# Altium project Phaser.PrjPCB (part 1 of 11)
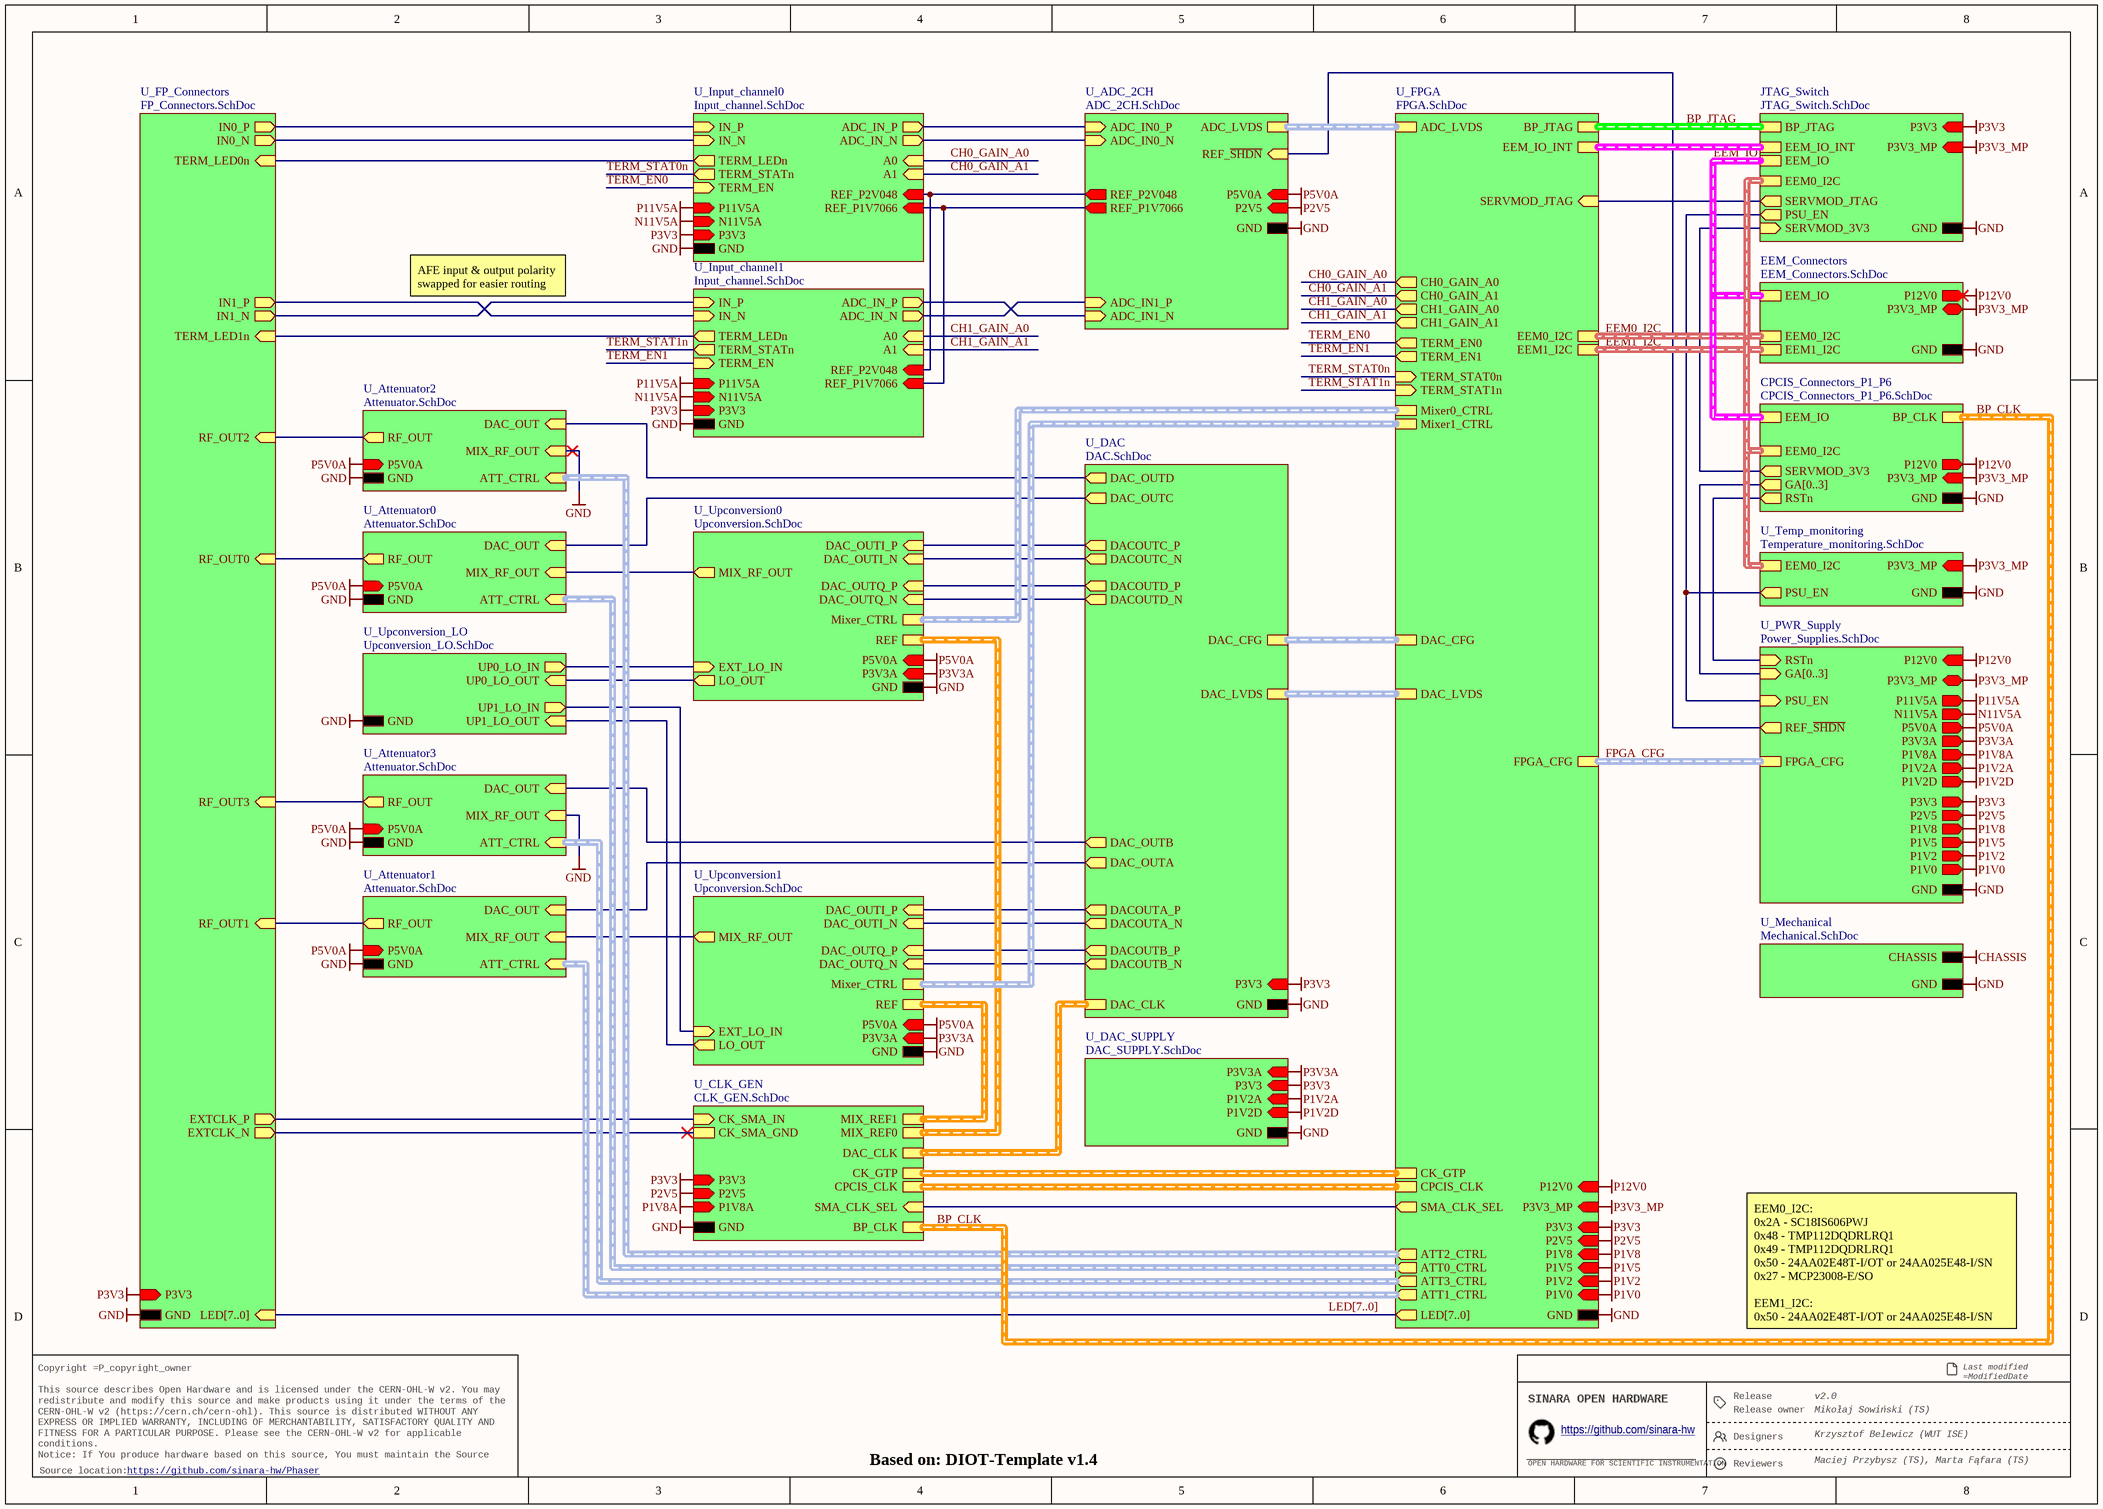
[diagram p0: Phaser.SchDoc]
P_copyright_owner: WUT ISE 2024-2026 · Technosystem 2025-2026; P_github_link: https://github.com/sinara-hw/Phaser; P_release_designers: Krzysztof Belewicz (WUT ISE); P_release_owner: Mikołaj Sowiński (TS); P_release_reviewers: Maciej Przybysz (TS), Marta Fąfara (TS); P_template_version: 1.4; P_version: 2.0
30 sheets, 1236 parts. Net scope: strictly hierarchical (ports join the sheet entries above them; power ports are local).
Board file: Phaser.PcbDoc
Sheets:
  Phaser.SchDoc
    U_PWR_Supply = Power_Supplies.SchDoc
      U_Power-up_delay = Power-up_delay.SchDoc
      U_Power_main_DCDC = Power_main_DCDC.SchDoc
      LEDs = LEDs.SchDoc
      U_Power_AFE_DCDC = Power_AFE_DCDC.SchDoc
    CPCIS_Connectors_P1_P6 = CPCIS_Connectors_P1_P6.SchDoc
      U_DIOT_signal_routing = DIOT_signal_routing.SchDoc
    EEM_Connectors = EEM_Connectors.SchDoc
    U_Temp_monitoring = Temperature_monitoring.SchDoc
    U_Mechanical = Mechanical.SchDoc
    U_FPGA = FPGA.SchDoc
      U_FPGA_Bank13-14 = FPGA_Bank13-14.SchDoc
      U_FPGA_Supply = FPGA_Supply.SchDoc
      U_FPGA_Config = FPGA_Config.SchDoc
      U_FPGA_Bank34 = FPGA_Bank34.SchDoc
      U_FPGA_Bank15-16 = FPGA_Bank15-16.SchDoc
      U_FPGA_SDRAM = FPGA_SDRAM.SchDoc
      U_FPGA_GTP = FPGA_GTP.SchDoc
      U_I2C switch_0 = I2C_switch.SchDoc
      U_I2C switch_1 = I2C_switch.SchDoc
    U_FP_Connectors = FP_Connectors.SchDoc
    U_CLK_GEN = CLK_GEN.SchDoc
    U_Input_channel0 = Input_channel.SchDoc
    U_DAC = DAC.SchDoc
    U_Upconversion0 = Upconversion.SchDoc
    U_DAC_SUPPLY = DAC_SUPPLY.SchDoc
    U_Input_channel1 = Input_channel.SchDoc
    U_ADC_2CH = ADC_2CH.SchDoc
    U_Upconversion_LO = Upconversion_LO.SchDoc
    U_Upconversion1 = Upconversion.SchDoc
    U_Attenuator0 = Attenuator.SchDoc
    U_Attenuator2 = Attenuator.SchDoc
    U_Attenuator1 = Attenuator.SchDoc
    U_Attenuator3 = Attenuator.SchDoc
    JTAG_Switch = JTAG_Switch.SchDoc

## Sheet Phaser.SchDoc: =DocumentName
size A3; Version: 2.0; Github: https://github.com/sinara-hw/Phaser; DocumentNumber: 1; Revision: 0; SheetNumber: 1; SheetTotal: 30

### Sub-sheets
CPCIS_Connectors_P1_P6 = CPCIS_Connectors_P1_P6.SchDoc: EEM_IO (harness EEM_LVDS), BP_CLK (harness CLK_DIFF), EEM0_I2C (harness I2C), SERVMOD_3V3 (out), GA[0..3] (out), RSTn (out), GND, P3V3_MP (in), P12V0 (out)
EEM_Connectors = EEM_Connectors.SchDoc: P3V3_MP (bidir), P12V0 (out), EEM_IO (harness EEM_LVDS), EEM1_I2C (harness I2C), EEM0_I2C (harness I2C), GND
JTAG_Switch = JTAG_Switch.SchDoc: BP_JTAG (harness BP_JTAG), EEM_IO_INT (harness EEM_LVDS), P3V3_MP (in), P3V3 (in), EEM0_I2C (harness I2C), EEM_IO (harness EEM_LVDS), SERVMOD_3V3 (in), PSU_EN (out), SERVMOD_JTAG (out), GND
U_ADC_2CH = ADC_2CH.SchDoc: REF_~{SHDN} (in), ADC_IN0_P (in), ADC_IN1_P (in), ADC_IN0_N (in), ADC_IN1_N (in), ADC_LVDS (harness ADC_LVDS), P5V0A (in), P2V5 (in), REF_P2V048 (out), REF_P1V7066 (out), GND
U_Attenuator0 = Attenuator.SchDoc: RF_OUT (out), ATT_CTRL (in, harness ATT_CTRL), DAC_OUT (in), MIX_RF_OUT (in), GND, P5V0A (in)
U_Attenuator1 = Attenuator.SchDoc: RF_OUT (out), ATT_CTRL (in, harness ATT_CTRL), DAC_OUT (in), MIX_RF_OUT (in), GND, P5V0A (in)
U_Attenuator2 = Attenuator.SchDoc: RF_OUT (out), DAC_OUT (in), MIX_RF_OUT (in), GND, P5V0A (in), ATT_CTRL (in, harness ATT_CTRL)
U_Attenuator3 = Attenuator.SchDoc: RF_OUT (out), DAC_OUT (in), MIX_RF_OUT (in), GND, P5V0A (in), ATT_CTRL (in, harness ATT_CTRL)
U_CLK_GEN = CLK_GEN.SchDoc: CK_SMA_IN (in), SMA_CLK_SEL (in), CK_GTP (harness CLK_DIFF), MIX_REF0 (harness CLK_DIFF), MIX_REF1 (harness CLK_DIFF), DAC_CLK (harness CLK_DIFF), CK_SMA_GND, GND, BP_CLK (harness CLK_DIFF), P2V5 (in), P1V8A (in), CPCIS_CLK (harness CLK_DIFF), P3V3 (in)
U_DAC = DAC.SchDoc: DAC_CFG (harness DAC_CFG), DAC_LVDS (harness DAC_LVDS), DAC_CLK (harness CLK_DIFF), DAC_OUTC (out), DAC_OUTA (out), DACOUTD_P (out), DACOUTD_N (out), DACOUTC_N (out), DACOUTC_P (out), DACOUTA_P (out), DACOUTA_N (out), DACOUTB_N (out), DACOUTB_P (out), GND, P3V3 (in), DAC_OUTD (out), DAC_OUTB (out)
U_DAC_SUPPLY = DAC_SUPPLY.SchDoc: P3V3A (in), P3V3 (in), P1V2A (in), P1V2D (in), GND
U_FP_Connectors = FP_Connectors.SchDoc: GND, P3V3 (in), IN0_P (out), IN0_N (out), IN1_P (out), IN1_N (out), RF_OUT2 (in), RF_OUT1 (in), EXTCLK_P (out), EXTCLK_N (out), RF_OUT0 (in), RF_OUT3 (in), LED[7..0] (in), TERM_LED0n (in), TERM_LED1n (in)
U_FPGA = FPGA.SchDoc: ADC_LVDS (harness ADC_LVDS), DAC_CFG (harness DAC_CFG), DAC_LVDS (harness DAC_LVDS), LED[7..0] (out), TERM_STAT1n (in), TERM_STAT0n (in), Mixer1_CTRL (harness Mixer_CTRL), Mixer0_CTRL (harness Mixer_CTRL), ATT2_CTRL (out, harness ATT_CTRL), SMA_CLK_SEL (out), GND, CK_GTP (harness CLK_DIFF), CPCIS_CLK (harness CLK_DIFF), P1V2 (in), P2V5 (in), P3V3 (in), P3V3_MP (in), P1V5 (in), P1V8 (in), P1V0 (in), P12V0 (in), ATT0_CTRL (out, harness ATT_CTRL), ATT3_CTRL (out, harness ATT_CTRL), ATT1_CTRL (out, harness ATT_CTRL), CH0_GAIN_A0 (out), CH0_GAIN_A1 (out), CH1_GAIN_A0 (out), CH1_GAIN_A1 (out), TERM_EN0 (out), TERM_EN1 (out), EEM_IO_INT (harness EEM_LVDS), BP_JTAG (harness BP_JTAG), SERVMOD_JTAG (in), FPGA_CFG (harness FPGA_CFG), EEM1_I2C (harness I2C), EEM0_I2C (harness I2C)
U_Input_channel0 = Input_channel.SchDoc: IN_N (in), A0 (in), A1 (in), IN_P (in), ADC_IN_P (out), ADC_IN_N (out), REF_P1V7066 (in), REF_P2V048 (in), GND, TERM_STATn (out), TERM_EN (in), P11V5A (in), N11V5A (in), P3V3 (in), TERM_LEDn (out)
U_Input_channel1 = Input_channel.SchDoc: IN_N (in), A0 (in), A1 (in), IN_P (in), ADC_IN_P (out), ADC_IN_N (out), TERM_STATn (out), REF_P1V7066 (in), REF_P2V048 (in), GND, TERM_EN (in), P11V5A (in), N11V5A (in), P3V3 (in), TERM_LEDn (out)
U_Mechanical = Mechanical.SchDoc: CHASSIS, GND
U_PWR_Supply = Power_Supplies.SchDoc: P12V0 (in), P3V3_MP (bidir), GND, P5V0A (out), P3V3A (out), P1V8A (out), P1V2A (out), P1V2D (out), P3V3 (out), P2V5 (out), P1V8 (out), P1V5 (out), P1V2 (out), P1V0 (out), P11V5A (out), N11V5A (out), RSTn (in), GA[0..3] (in), PSU_EN (in), REF_~{SHDN} (out), FPGA_CFG (harness FPGA_CFG)
U_Temp_monitoring = Temperature_monitoring.SchDoc: GND, P3V3_MP (in), EEM0_I2C (harness I2C), PSU_EN (out)
U_Upconversion0 = Upconversion.SchDoc: DAC_OUTI_P (in), DAC_OUTI_N (in), DAC_OUTQ_N (in), DAC_OUTQ_P (in), REF (harness CLK_DIFF), MIX_RF_OUT (out), Mixer_CTRL (harness Mixer_CTRL), EXT_LO_IN (in), LO_OUT (out), P5V0A (in), P3V3A (in), GND
U_Upconversion1 = Upconversion.SchDoc: DAC_OUTI_P (in), DAC_OUTI_N (in), DAC_OUTQ_N (in), DAC_OUTQ_P (in), REF (harness CLK_DIFF), MIX_RF_OUT (out), Mixer_CTRL (harness Mixer_CTRL), EXT_LO_IN (in), LO_OUT (out), P5V0A (in), P3V3A (in), GND
U_Upconversion_LO = Upconversion_LO.SchDoc: GND, UP0_LO_IN (out), UP0_LO_OUT (in), UP1_LO_IN (out), UP1_LO_OUT (in)

### Nets
GND: sheet U_PWR_Supply/GND, sheet CPCIS_Connectors_P1_P6/GND, sheet EEM_Connectors/GND, sheet U_Temp_monitoring/GND, sheet U_Mechanical/GND, sheet U_FPGA/GND, sheet U_FP_Connectors/GND, sheet U_CLK_GEN/GND, sheet U_Input_channel0/GND, sheet U_DAC/GND, sheet U_Upconversion0/GND, sheet U_DAC_SUPPLY/GND, sheet U_Input_channel1/GND, sheet U_ADC_2CH/GND, sheet U_Upconversion_LO/GND, sheet U_Upconversion1/GND, sheet U_Attenuator0/GND, sheet U_Attenuator2/MIX_RF_OUT, sheet U_Attenuator2/GND, sheet U_Attenuator1/GND, sheet U_Attenuator3/MIX_RF_OUT, sheet U_Attenuator3/GND, sheet JTAG_Switch/GND
N11V5A: sheet U_PWR_Supply/N11V5A, sheet U_Input_channel0/N11V5A, sheet U_Input_channel1/N11V5A
P1V0: sheet U_PWR_Supply/P1V0, sheet U_FPGA/P1V0
P1V2: sheet U_PWR_Supply/P1V2, sheet U_FPGA/P1V2
P1V2A: sheet U_PWR_Supply/P1V2A, sheet U_DAC_SUPPLY/P1V2A
P1V2D: sheet U_PWR_Supply/P1V2D, sheet U_DAC_SUPPLY/P1V2D
P1V5: sheet U_PWR_Supply/P1V5, sheet U_FPGA/P1V5
P1V8: sheet U_PWR_Supply/P1V8, sheet U_FPGA/P1V8
P1V8A: sheet U_PWR_Supply/P1V8A, sheet U_CLK_GEN/P1V8A
P2V5: sheet U_PWR_Supply/P2V5, sheet U_FPGA/P2V5, sheet U_CLK_GEN/P2V5, sheet U_ADC_2CH/P2V5
P3V3: sheet U_PWR_Supply/P3V3, sheet U_FPGA/P3V3, sheet U_FP_Connectors/P3V3, sheet U_CLK_GEN/P3V3, sheet U_Input_channel0/P3V3, sheet U_DAC/P3V3, sheet U_DAC_SUPPLY/P3V3, sheet U_Input_channel1/P3V3, sheet JTAG_Switch/P3V3
P3V3_MP: sheet U_PWR_Supply/P3V3_MP, sheet CPCIS_Connectors_P1_P6/P3V3_MP, sheet EEM_Connectors/P3V3_MP, sheet U_Temp_monitoring/P3V3_MP, sheet U_FPGA/P3V3_MP, sheet JTAG_Switch/P3V3_MP
P3V3A: sheet U_PWR_Supply/P3V3A, sheet U_Upconversion0/P3V3A, sheet U_DAC_SUPPLY/P3V3A, sheet U_Upconversion1/P3V3A
P5V0A: sheet U_PWR_Supply/P5V0A, sheet U_Upconversion0/P5V0A, sheet U_ADC_2CH/P5V0A, sheet U_Upconversion1/P5V0A, sheet U_Attenuator0/P5V0A, sheet U_Attenuator2/P5V0A, sheet U_Attenuator1/P5V0A, sheet U_Attenuator3/P5V0A
P11V5A: sheet U_PWR_Supply/P11V5A, sheet U_Input_channel0/P11V5A, sheet U_Input_channel1/P11V5A
P12V0: sheet U_PWR_Supply/P12V0, sheet CPCIS_Connectors_P1_P6/P12V0, sheet EEM_Connectors/P12V0, sheet U_FPGA/P12V0
REF_P1V7066: sheet U_Input_channel0/REF_P1V7066, sheet U_Input_channel1/REF_P1V7066, sheet U_ADC_2CH/REF_P1V7066
REF_P2V048: sheet U_Input_channel0/REF_P2V048, sheet U_Input_channel1/REF_P2V048, sheet U_ADC_2CH/REF_P2V048
ADC_IN0_N: sheet U_Input_channel0/ADC_IN_N, sheet U_ADC_2CH/ADC_IN0_N
ADC_IN0_P: sheet U_Input_channel0/ADC_IN_P, sheet U_ADC_2CH/ADC_IN0_P
ADC_IN1_N: sheet U_Input_channel1/ADC_IN_P, sheet U_ADC_2CH/ADC_IN1_N
ADC_IN1_P: sheet U_Input_channel1/ADC_IN_N, sheet U_ADC_2CH/ADC_IN1_P
BBI_N: sheet U_DAC/DACOUTA_N, sheet U_Upconversion1/DAC_OUTI_N
BBI_N: sheet U_DAC/DACOUTC_N, sheet U_Upconversion0/DAC_OUTI_N  [a separate net that carries the same name]
BBI_P: sheet U_DAC/DACOUTA_P, sheet U_Upconversion1/DAC_OUTI_P
BBI_P: sheet U_DAC/DACOUTC_P, sheet U_Upconversion0/DAC_OUTI_P  [a separate net that carries the same name]
BBQ_N: sheet U_DAC/DACOUTB_N, sheet U_Upconversion1/DAC_OUTQ_N
BBQ_N: sheet U_DAC/DACOUTD_N, sheet U_Upconversion0/DAC_OUTQ_N  [a separate net that carries the same name]
BBQ_P: sheet U_DAC/DACOUTB_P, sheet U_Upconversion1/DAC_OUTQ_P
BBQ_P: sheet U_DAC/DACOUTD_P, sheet U_Upconversion0/DAC_OUTQ_P  [a separate net that carries the same name]
CH0_GAIN_A0: sheet U_FPGA/CH0_GAIN_A0, sheet U_Input_channel0/A0
CH0_GAIN_A1: sheet U_FPGA/CH0_GAIN_A1, sheet U_Input_channel0/A1
CH1_GAIN_A0: sheet U_FPGA/CH1_GAIN_A0, sheet U_Input_channel1/A0
CH1_GAIN_A1: sheet U_FPGA/CH1_GAIN_A1, sheet U_Input_channel1/A1
PSU_EN: sheet U_PWR_Supply/PSU_EN, sheet U_Temp_monitoring/PSU_EN, sheet JTAG_Switch/PSU_EN
REF_~{SHDN}: sheet U_PWR_Supply/REF_~{SHDN}, sheet U_ADC_2CH/REF_~{SHDN}
RSTn: sheet U_PWR_Supply/RSTn, sheet CPCIS_Connectors_P1_P6/RSTn
SERVMOD_3V3: sheet CPCIS_Connectors_P1_P6/SERVMOD_3V3, sheet JTAG_Switch/SERVMOD_3V3
SERVMOD_JTAG: sheet U_FPGA/SERVMOD_JTAG, sheet JTAG_Switch/SERVMOD_JTAG
SMA_CLK_SEL: sheet U_FPGA/SMA_CLK_SEL, sheet U_CLK_GEN/SMA_CLK_SEL
TERM_EN0: sheet U_FPGA/TERM_EN0, sheet U_Input_channel0/TERM_EN
TERM_EN1: sheet U_FPGA/TERM_EN1, sheet U_Input_channel1/TERM_EN
TERM_STAT0n: sheet U_FPGA/TERM_STAT0n, sheet U_FP_Connectors/TERM_LED0n, sheet U_Input_channel0/TERM_STATn, sheet U_Input_channel0/TERM_LEDn
TERM_STAT1n: sheet U_FPGA/TERM_STAT1n, sheet U_FP_Connectors/TERM_LED1n, sheet U_Input_channel1/TERM_STATn, sheet U_Input_channel1/TERM_LEDn
NetC11_1: sheet U_FP_Connectors/IN0_N, sheet U_Input_channel0/IN_N
NetC31_1: sheet U_FP_Connectors/IN1_N, sheet U_Input_channel1/IN_P
NetC37_1: sheet U_FP_Connectors/EXTCLK_N, sheet U_CLK_GEN/CK_SMA_GND
NetC133A_1: sheet U_Upconversion0/EXT_LO_IN, sheet U_Upconversion_LO/UP0_LO_IN
NetC133B_1: sheet U_Upconversion_LO/UP1_LO_IN, sheet U_Upconversion1/EXT_LO_IN
NetC196_2: sheet U_FP_Connectors/EXTCLK_P, sheet U_CLK_GEN/CK_SMA_IN
NetC270A_2: sheet U_DAC/DAC_OUTC, sheet U_Attenuator0/DAC_OUT
NetC270B_2: sheet U_DAC/DAC_OUTA, sheet U_Attenuator1/DAC_OUT
NetC270C_2: sheet U_DAC/DAC_OUTD, sheet U_Attenuator2/DAC_OUT
NetC270D_2: sheet U_DAC/DAC_OUTB, sheet U_Attenuator3/DAC_OUT
NetC272A_1: sheet U_FP_Connectors/RF_OUT0, sheet U_Attenuator0/RF_OUT
NetC272B_1: sheet U_FP_Connectors/RF_OUT1, sheet U_Attenuator1/RF_OUT
NetC272C_1: sheet U_FP_Connectors/RF_OUT2, sheet U_Attenuator2/RF_OUT
NetC272D_1: sheet U_FP_Connectors/RF_OUT3, sheet U_Attenuator3/RF_OUT
NetC354A_1: sheet U_Upconversion0/LO_OUT, sheet U_Upconversion_LO/UP0_LO_OUT
NetC354B_1: sheet U_Upconversion_LO/UP1_LO_OUT, sheet U_Upconversion1/LO_OUT
NetC369A_1: sheet U_Upconversion0/MIX_RF_OUT, sheet U_Attenuator0/MIX_RF_OUT
NetC369B_1: sheet U_Upconversion1/MIX_RF_OUT, sheet U_Attenuator1/MIX_RF_OUT
NetIC27B_6: sheet U_FP_Connectors/IN1_P, sheet U_Input_channel1/IN_N
NetJ13_1: sheet U_FP_Connectors/IN0_P, sheet U_Input_channel0/IN_P

### Buses and harness runs
bus LED[7..0] = sheet U_FP_Connectors/LED[7..0] = sheet U_FPGA/LED[7..0]
bus sheet CPCIS_Connectors_P1_P6/GA[0..3] = sheet U_PWR_Supply/GA[0..3]
harness BP_CLK = sheet CPCIS_Connectors_P1_P6/BP_CLK = sheet U_CLK_GEN/BP_CLK
harness BP_JTAG = sheet JTAG_Switch/BP_JTAG = sheet U_FPGA/BP_JTAG
harness EEM0_I2C = sheet CPCIS_Connectors_P1_P6/EEM0_I2C = sheet EEM_Connectors/EEM0_I2C = sheet JTAG_Switch/EEM0_I2C = sheet U_FPGA/EEM0_I2C = sheet U_Temp_monitoring/EEM0_I2C
harness EEM1_I2C = sheet EEM_Connectors/EEM1_I2C = sheet U_FPGA/EEM1_I2C
harness EEM_IO = sheet CPCIS_Connectors_P1_P6/EEM_IO = sheet EEM_Connectors/EEM_IO = sheet JTAG_Switch/EEM_IO
harness FPGA_CFG = sheet U_FPGA/FPGA_CFG = sheet U_PWR_Supply/FPGA_CFG
harness sheet JTAG_Switch/EEM_IO_INT = sheet U_FPGA/EEM_IO_INT
harness sheet U_ADC_2CH/ADC_LVDS = sheet U_FPGA/ADC_LVDS
harness sheet U_Attenuator0/ATT_CTRL = sheet U_FPGA/ATT0_CTRL
harness sheet U_Attenuator1/ATT_CTRL = sheet U_FPGA/ATT1_CTRL
harness sheet U_Attenuator2/ATT_CTRL = sheet U_FPGA/ATT2_CTRL
harness sheet U_Attenuator3/ATT_CTRL = sheet U_FPGA/ATT3_CTRL
harness sheet U_CLK_GEN/CK_GTP = sheet U_FPGA/CK_GTP
harness sheet U_CLK_GEN/CPCIS_CLK = sheet U_FPGA/CPCIS_CLK
harness sheet U_CLK_GEN/DAC_CLK = sheet U_DAC/DAC_CLK
harness sheet U_CLK_GEN/MIX_REF0 = sheet U_Upconversion0/REF
harness sheet U_CLK_GEN/MIX_REF1 = sheet U_Upconversion1/REF
harness sheet U_DAC/DAC_CFG = sheet U_FPGA/DAC_CFG
harness sheet U_DAC/DAC_LVDS = sheet U_FPGA/DAC_LVDS
harness sheet U_FPGA/Mixer0_CTRL = sheet U_Upconversion0/Mixer_CTRL
harness sheet U_FPGA/Mixer1_CTRL = sheet U_Upconversion1/Mixer_CTRL

### Notes on the sheet
- AFE input & output polarity swapped for easier routing
- EEM0_I2C:
  0x2A - SC18IS606PWJ
  0x48 - TMP112DQDRLRQ1
  0x49 - TMP112DQDRLRQ1
  0x50 - 24AA02E48T-I/OT or 24AA025E48-I/SN
  0x27 - MCP23008-E/SO
  EEM1_I2C:
  0x50 - 24AA02E48T-I/OT or 24AA025E48-I/SN
- Release
- Last modified =ModifiedDate
  Sheet =sheetnumber of =sheettotal · Size A3
- Copyright =P_copyright_owner
  This source describes Open Hardware and is licensed under the CERN-OHL-W v2. You may redistribute and modify this source and make products using it under the terms of the CERN-OHL-W v2 (https://cern.ch/cern-ohl). This source is distributed WITHOUT ANY EXPRESS OR IMPLIED WARRANTY, INCLUDING OF MERCHANTABILITY, SATISFACTORY QUALITY AND FITNESS FOR A PARTICULAR PURPOSE. Please see the CERN-OHL-W v2 for applicable conditions.
  Notice: If You produce hardware based on this source, You must maintain the Source Location visible on the product, its packaging or its documentation.
- SINARA OPEN HARDWARE
- OPEN HARDWARE FOR SCIENTIFIC INSTRUMENTATION
- https://github.com/sinara-hw
- Release owner
- Designers
- Reviewers
- Source location:

## Sheet Power_Supplies.SchDoc: =DocumentName
size A4; DocumentNumber: 1; Revision: 0; SheetNumber: 2; SheetTotal: 30
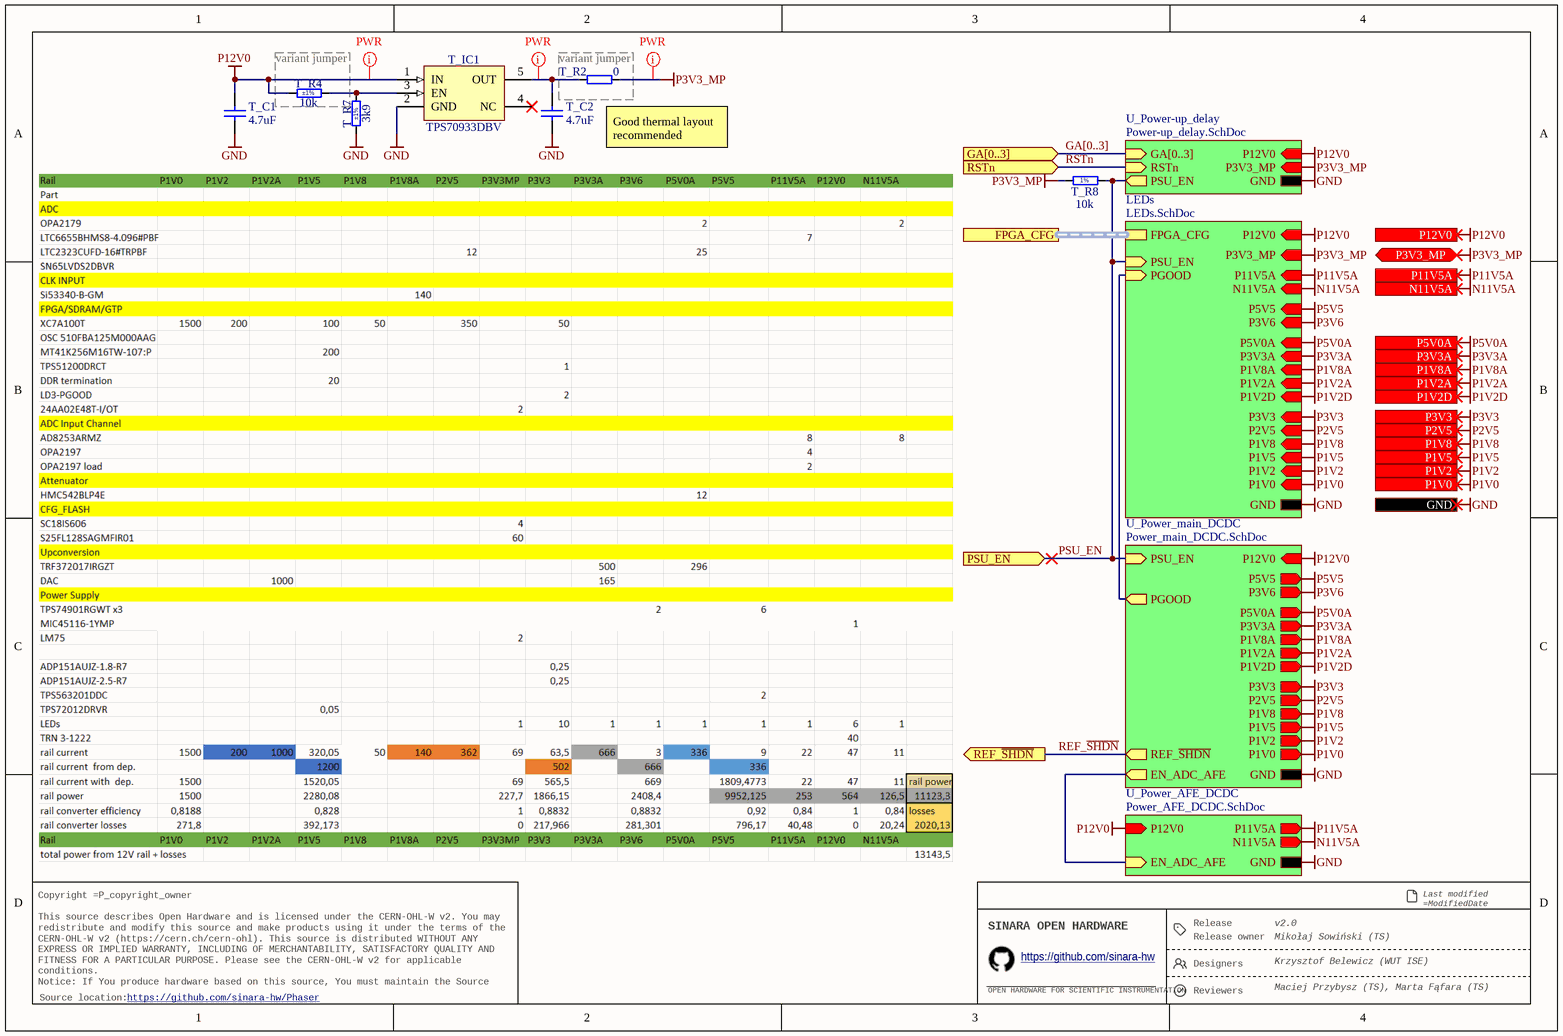
[diagram p1: Power_Supplies.SchDoc]

### Parts
T_C1  4.7uF  [CAPC2012X135N]
T_C2  4.7uF  [CAPC2012X135N]
T_IC1  TPS70933DBV  [SOT95P280X145-5N]
T_R2  0  [RESC1005X40N]
T_R4  10k  Tolerance: ±1%  [RESC1005X40N]
T_R7  3k9  Tolerance: ±1%  [RESC1005X40N]
T_R8  10k  [RESC1005X40N]

### Blocks framed on the sheet
variant jumper: T_R4
variant jumper: T_R2

### Sub-sheets
LEDs = LEDs.SchDoc: PSU_EN (in), PGOOD (in), P3V3_MP (in), P12V0 (in), FPGA_CFG (harness FPGA_CFG), P11V5A (in), N11V5A (in), GND, P5V0A (in), P3V3A (in), P1V8A (in), P1V2A (in), P1V2D (in), P3V3 (in), P2V5 (in), P1V8 (in), P1V5 (in), P1V2 (in), P1V0 (in), P5V5 (in), P3V6 (in)
U_Power-up_delay = Power-up_delay.SchDoc: GA[0..3] (in), RSTn (in), GND, PSU_EN (out), P3V3_MP (in), P12V0 (in)
U_Power_AFE_DCDC = Power_AFE_DCDC.SchDoc: P12V0 (in), P11V5A (out), GND, EN_ADC_AFE (in), N11V5A (out)
U_Power_main_DCDC = Power_main_DCDC.SchDoc: P12V0 (in), P5V0A (out), GND, PSU_EN (in), PGOOD (out), EN_ADC_AFE (out), REF_~{SHDN} (out), P3V3A (out), P1V8A (out), P1V2A (out), P1V2D (out), P3V3 (out), P2V5 (out), P1V8 (out), P1V5 (out), P1V2 (out), P1V0 (out), P5V5 (out), P3V6 (out)

### Ports
FPGA_CFG (harness FPGA_CFG), GA[0..3] (in), GND, N11V5A (out), P1V0 (out), P1V2 (out), P1V2A (out), P1V2D (out), P1V5 (out), P1V8 (out), P1V8A (out), P2V5 (out), P3V3 (out), P3V3_MP (bidir), P3V3A (out), P5V0A (out), P11V5A (out), P12V0 (in), PSU_EN (in), REF_~{SHDN} (out), RSTn (in)

### Nets
GND: T_C1.1 T_C2.1 T_IC1.2(GND) T_R7.1 ; port GND, sheet U_Power-up_delay/GND, sheet U_Power_main_DCDC/GND, sheet LEDs/GND, sheet U_Power_AFE_DCDC/GND
N11V5A: port N11V5A, sheet LEDs/N11V5A, sheet U_Power_AFE_DCDC/N11V5A
P1V0: port P1V0, sheet U_Power_main_DCDC/P1V0, sheet LEDs/P1V0
P1V2: port P1V2, sheet U_Power_main_DCDC/P1V2, sheet LEDs/P1V2
P1V2A: port P1V2A, sheet U_Power_main_DCDC/P1V2A, sheet LEDs/P1V2A
P1V2D: port P1V2D, sheet U_Power_main_DCDC/P1V2D, sheet LEDs/P1V2D
P1V5: port P1V5, sheet U_Power_main_DCDC/P1V5, sheet LEDs/P1V5
P1V8: port P1V8, sheet U_Power_main_DCDC/P1V8, sheet LEDs/P1V8
P1V8A: port P1V8A, sheet U_Power_main_DCDC/P1V8A, sheet LEDs/P1V8A
P2V5: port P2V5, sheet U_Power_main_DCDC/P2V5, sheet LEDs/P2V5
P3V3: port P3V3, sheet U_Power_main_DCDC/P3V3, sheet LEDs/P3V3
P3V3_MP: T_R2.2 T_R8.2 ; port P3V3_MP, sheet U_Power-up_delay/P3V3_MP, sheet LEDs/P3V3_MP
P3V3A: port P3V3A, sheet U_Power_main_DCDC/P3V3A, sheet LEDs/P3V3A
P3V6: sheet U_Power_main_DCDC/P3V6, sheet LEDs/P3V6
P5V0A: port P5V0A, sheet U_Power_main_DCDC/P5V0A, sheet LEDs/P5V0A
P5V5: sheet U_Power_main_DCDC/P5V5, sheet LEDs/P5V5
P11V5A: port P11V5A, sheet LEDs/P11V5A, sheet U_Power_AFE_DCDC/P11V5A
P12V0: T_C1.2 T_IC1.1(IN) T_R4.1 ; port P12V0, sheet U_Power-up_delay/P12V0, sheet U_Power_main_DCDC/P12V0, sheet LEDs/P12V0, sheet U_Power_AFE_DCDC/P12V0
PGOOD: sheet U_Power_main_DCDC/PGOOD, sheet LEDs/PGOOD
PSU_EN: T_R8.1 ; port PSU_EN, sheet U_Power-up_delay/PSU_EN, sheet U_Power_main_DCDC/PSU_EN, sheet LEDs/PSU_EN
REF_~{SHDN}: port REF_~{SHDN}, sheet U_Power_main_DCDC/REF_~{SHDN}
RSTn: port RSTn, sheet U_Power-up_delay/RSTn
NetIC7_3: sheet U_Power_main_DCDC/EN_ADC_AFE, sheet U_Power_AFE_DCDC/EN_ADC_AFE
NetT_C2_2: T_C2.2 T_IC1.5(OUT) T_R2.1
NetT_IC1_3: T_IC1.3(EN) T_R4.2 T_R7.2

Not connected (* = marked no-connect by the designer): T_IC1 4(NC)*

### Buses and harness runs
bus GA[0..3] = port GA[0..3] = sheet U_Power-up_delay/GA[0..3]
harness port FPGA_CFG = sheet LEDs/FPGA_CFG

### Layout directives
net class PWR: NetT_C2_2, P3V3_MP, P12V0

### Notes on the sheet
- (near T_R2) Good thermal layout recommended
- Release
- Last modified =ModifiedDate
  Sheet =sheetnumber of =sheettotal · Size A4
- Copyright =P_copyright_owner
  This source describes Open Hardware and is licensed under the CERN-OHL-W v2. You may redistribute and modify this source and make products using it under the terms of the CERN-OHL-W v2 (https://cern.ch/cern-ohl). This source is distributed WITHOUT ANY EXPRESS OR IMPLIED WARRANTY, INCLUDING OF MERCHANTABILITY, SATISFACTORY QUALITY AND FITNESS FOR A PARTICULAR PURPOSE. Please see the CERN-OHL-W v2 for applicable conditions.
  Notice: If You produce hardware based on this source, You must maintain the Source Location visible on the product, its packaging or its documentation.
- SINARA OPEN HARDWARE
- OPEN HARDWARE FOR SCIENTIFIC INSTRUMENTATION
- https://github.com/sinara-hw
- Release owner
- Designers
- Reviewers
- Source location:
- (in symbol R0402_10K_1%_0.0625W_100PPM) 1%

### Library data of the parts
T_C1 T_C2 = CC0805_4.7UF_16V_10%_X7R: Non-polarised capacitor; Part Description: SMD Multilayer Chip Ceramic Capacitor; Manufacturer: GENERIC; Manufacturer1 Part Number: EMK212B7475KG-T; Voltage: 16V; TC: X7R; Tolerance: ±10%; Part Number: CC0805_4.7UF_16V_10%_X7R; Component Kind: Standard; Component Type: Standard; Pin Count: 2; Value: 4.7uF; Status: Preferred; Manufacturer Part Number: CC0805_4.7UF_16V_10%_X7R; Case: 0805; Mounted: Yes; Socket: No; SMD: Yes; Sense: No; Manufacturer1 Example: TAIYO YUDEN; Manufacturer1 ComponentHeight: 1.35mm; HelpURL: \\cern.ch\dfs\Applications\Altium\Datasheets\CC0805_X7R_TAIYO-YUDEN_HIGH-VALUE.pdf; Author: CERN DEM JLC; CreateDate: 16.09.2014; LatestRevisionDate: 16.09.2014
T_IC1 = TPS70933DBV: 150-mA, 30-V, 1-µA IQ Voltage Regulators with Enable; Part Description: 3.3V, 150-mA, 30-V, 1-µA IQ Voltage Regulators with Enable; Manufacturer: TEXAS INSTRUMENTS; PressFit: No; Bonding: No; Part Number: TPS70933DBV; Component Kind: Standard; Component Type: Standard; Device: TPS70933DBV; PackageDescription: SOT23, 0.95mm Pitch; 5 Pin, 1.60mm W X 2.90mm L X 1.45mm H body, IPC Medium Density; Manufacturer Part Number: TPS70933DBV; Pin Count: 5; Case: SOT23-5; Mounted: Yes; Socket: No; SMD: Yes; Sense: No; ComponentHeight: 1.45mm; HelpURL: \\cern.ch\dfs\Applications\Altium\Datasheets\TPS709.pdf; Author: CERN DEM JLC; CreateDate: 17.03.2011; LatestRevisionDate: 17.03.2011
T_R2 = R0402_0R_JUMPER: Resistor; Part Description: 1A (0.05R Max DC Resistance) Zero Ohm Jumper; Manufacturer: GENERIC; Manufacturer1 Part Number: 232270591001L; PressFit: No; Part Number: R0402_0R_JUMPER; Component Kind: Standard; Component Type: Standard; Pin Count: 2; Value: 0; Status: Not Recommended; Manufacturer Part Number: R0402_0R_JUMPER; Case: 0402; Mounted: Yes; Sense: No; Socket: No; SMD: Yes; Manufacturer1 Example: YAGEO PHYCOMP; Manufacturer1 ComponentHeight: 0.4mm; HelpURL: \\cern.ch\dfs\Applications\Altium\Datasheets\R0402_Phycomp_RC0402.pdf; Author: CERN DEM JLC; CreateDate: 03.12.2007; LatestRevisionDate: 17.10.2012
T_R4 = R0402_10K_1%_0.0625W_100PPM: Resistor - 1%; Part Description: General Purpose Thick Film Chip Resistor; Manufacturer: GENERIC; Manufacturer1 Part Number: 232270671003L; TC: ±100ppm/°C; PressFit: No; Part Number: R0402_10K_1%_0.0625W_100PPM; Component Kind: Standard; Component Type: Standard; Pin Count: 2; Value: 10k; Status: Not Recommended; Power: 0.0625W; Manufacturer Part Number: R0402_10K_1%_0.0625W_100PPM; Case: 0402; Mounted: Yes; Sense: No; Socket: No; SMD: Yes; Manufacturer1 Example: YAGEO PHYCOMP; Manufacturer1 ComponentHeight: 0.4mm; HelpURL: \\cern.ch\dfs\Applications\Altium\Datasheets\R0402_Phycomp_RC0402.pdf; Author: CERN DEM JLC; CreateDate: 03.12.2007; LatestRevisionDate: 17.10.2012
T_R7 = R0402_3K9_1%_0.0625W_100PPM: Resistor - 1%; Part Description: General Purpose Thick Film Chip Resistor; Manufacturer: GENERIC; Manufacturer1 Part Number: 232270673902L; TC: ±100ppm/°C; PressFit: No; Part Number: R0402_3K9_1%_0.0625W_100PPM; Component Kind: Standard; Component Type: Standard; Pin Count: 2; Value: 3k9; Status: Not Recommended; Power: 0.0625W; Manufacturer Part Number: R0402_3K9_1%_0.0625W_100PPM; Case: 0402; Mounted: Yes; Sense: No; Socket: No; SMD: Yes; Manufacturer1 Example: YAGEO PHYCOMP; Manufacturer1 ComponentHeight: 0.4mm; HelpURL: \\cern.ch\dfs\Applications\Altium\Datasheets\R0402_Phycomp_RC0402.pdf; Author: CERN DEM JLC; CreateDate: 03.12.2007; LatestRevisionDate: 17.10.2012
T_R8 = R0402_10K_1%_0.0625W_100PPM: Resistor - 1%; Part Description: General Purpose Thick Film Chip Resistor; Manufacturer: GENERIC; Manufacturer1 Part Number: 232270671003L; TC: ±100ppm/°C; Part Number: R0402_10K_1%_0.0625W_100PPM; Component Kind: Standard; Component Type: Standard; Pin Count: 2; Value: 10k; Status: Not recommended; Power: 0.0625W; Tolerance: ±1%; Manufacturer Part Number: R0402_10K_1%_0.0625W_100PPM; Case: 0402; Mounted: Yes; Sense: No; Socket: No; SMD: Yes; Manufacturer1 Example: YAGEO PHYCOMP; Manufacturer1 ComponentHeight: 0.4mm; HelpURL: \\cern.ch\dfs\Applications\Altium\Datasheets\R0402_Phycomp_RC0402.pdf; Author: CERN DEM JLC; CreateDate: 03.12.2007; LatestRevisionDate: 17.10.2012

## Sheet Power-up_delay.SchDoc: =DocumentName
size A4; DocumentNumber: 1; Revision: 0; SheetNumber: 3; SheetTotal: 30
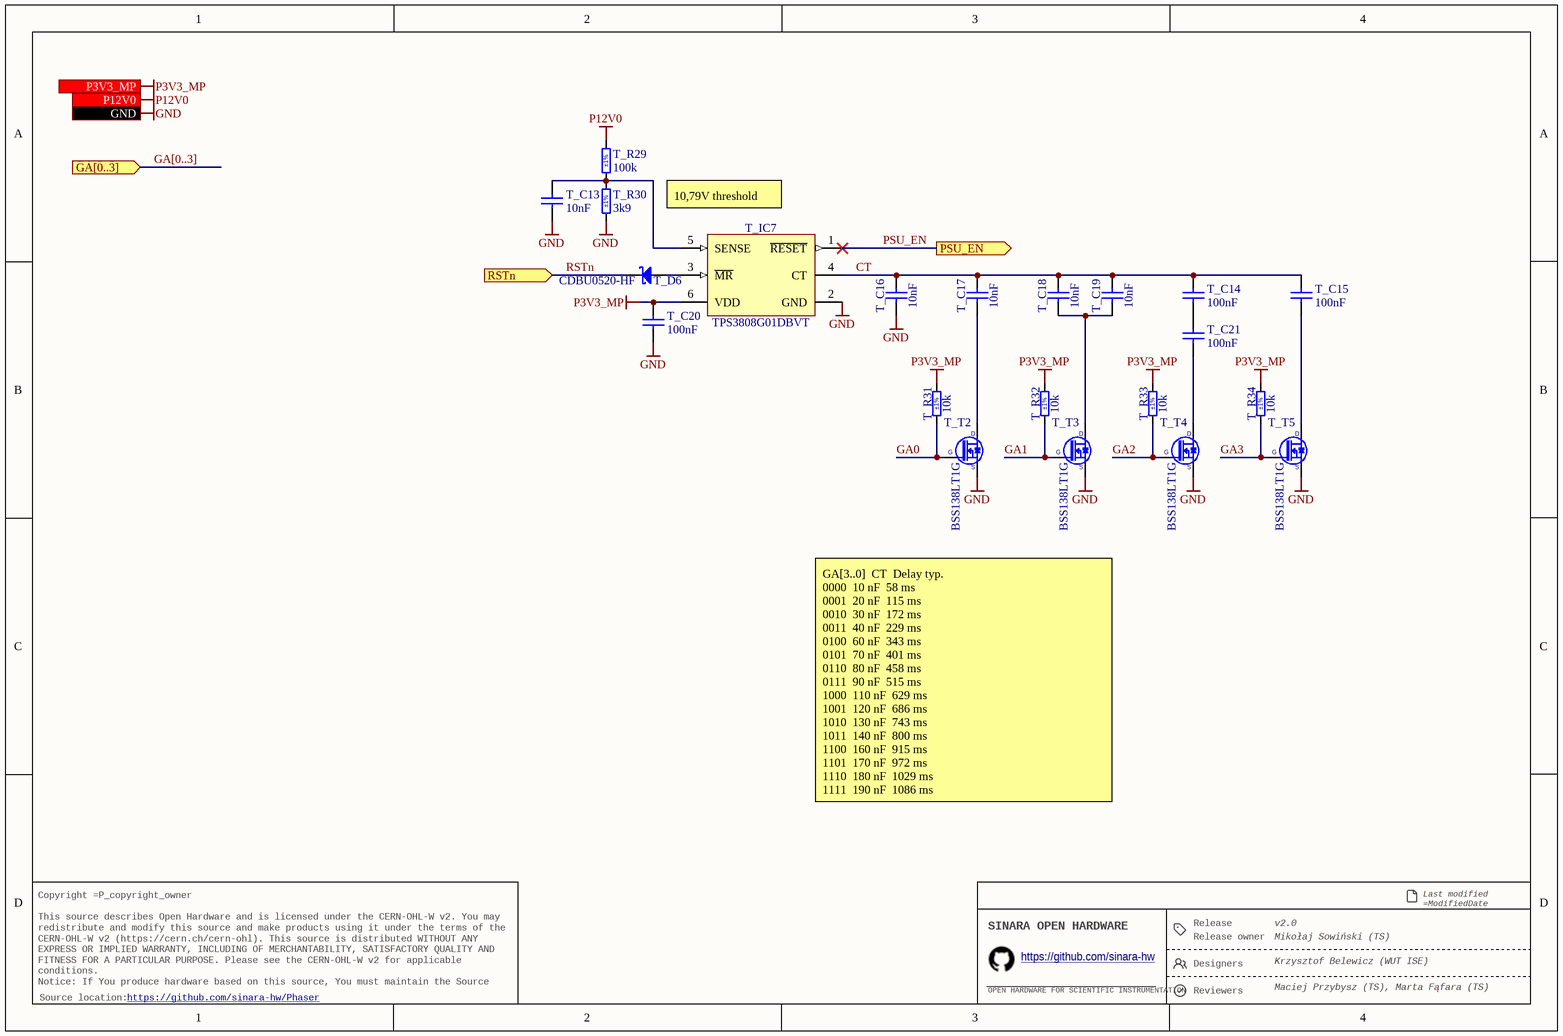
[diagram p2: Power-up_delay.SchDoc]

### Parts
T_C13  10nF  [CAPC1005X55N]
T_C14  100nF  [CAPC1005X55N]
T_C15  100nF  [CAPC1005X55N]
T_C16  10nF  [CAPC1005X55N]
T_C17  10nF  [CAPC1005X55N]
T_C18  10nF  [CAPC1005X55N]
T_C19  10nF  [CAPC1005X55N]
T_C20  100nF  [CAPC1005X55N]
T_C21  100nF  [CAPC1005X55N]
T_D6  CDBU0520-HF  [SOD-523F]
T_IC7  TPS3808G01DBVT  [SOT95P280X145-6N]
T_R29  100k  Tolerance: ±1%  [RESC1005X40N]
T_R30  3k9  Tolerance: ±1%  [RESC1005X40N]
T_R31  10k  Tolerance: ±1%  [RESC1005X40N]
T_R32  10k  Tolerance: ±1%  [RESC1005X40N]
T_R33  10k  Tolerance: ±1%  [RESC1005X40N]
T_R34  10k  Tolerance: ±1%  [RESC1005X40N]
T_T2  BSS138LT1G  [SOT95P240X110-3N]
T_T3  BSS138LT1G  [SOT95P240X110-3N]
T_T4  BSS138LT1G  [SOT95P240X110-3N]
T_T5  BSS138LT1G  [SOT95P240X110-3N]

### Ports
GA[0..3] (in), GND, P3V3_MP (in), P12V0 (in), PSU_EN (out), RSTn (in)

### Nets
GND: T_C13.2 T_C16.1 T_C20.1 T_IC7.2(GND) T_R30.1 T_T2.2(S) T_T3.2(S) T_T4.2(S) T_T5.2(S) ; port GND
P3V3_MP: T_C20.2 T_IC7.6(VDD) T_R31.2 T_R32.2 T_R33.2 T_R34.2 ; port P3V3_MP
P12V0: T_R29.1 ; port P12V0
CT: T_C14.2 T_C15.2 T_C16.2 T_C17.2 T_C18.2 T_C19.2 T_IC7.4(CT)
GA0: T_R31.1 T_T2.1(G)
GA1: T_R32.1 T_T3.1(G)
GA2: T_R33.1 T_T4.1(G)
GA3: T_R34.1 T_T5.1(G)
PSU_EN: T_IC7.1(~{RESET}) ; port PSU_EN
RSTn: T_D6.1(C) ; port RSTn
NetT_C13_1: T_C13.1 T_IC7.5(SENSE) T_R29.2 T_R30.2
NetT_C14_1: T_C14.1 T_C21.2
NetT_C15_1: T_C15.1 T_T5.3(D)
NetT_C17_1: T_C17.1 T_T2.3(D)
NetT_C18_1: T_C18.1 T_C19.1 T_T3.3(D)
NetT_C21_1: T_C21.1 T_T4.3(D)
NetT_D6_2: T_D6.2(A) T_IC7.3(~{MR})

### Buses and harness runs
bus GA[0..3] = port GA[0..3]

### Notes on the sheet
- 10,79V threshold
- GA[3..0]		CT		Delay typ.
  0000		10 nF		58 ms
  0001		20 nF		115 ms
  0010		30 nF		172 ms
  0011		40 nF		229 ms
  0100		60 nF		343 ms
  0101		70 nF		401 ms
  0110		80 nF		458 ms
  0111		90 nF		515 ms
  1000		110 nF		629 ms
  1001		120 nF		686 ms
  1010		130 nF		743 ms
  1011		140 nF		800 ms
  1100		160 nF		915 ms
  1101		170 nF		972 ms
  1110		180 nF		1029 ms
  1111		190 nF		1086 ms
- Release
- Last modified =ModifiedDate
  Sheet =sheetnumber of =sheettotal · Size A4
- Copyright =P_copyright_owner
  This source describes Open Hardware and is licensed under the CERN-OHL-W v2. You may redistribute and modify this source and make products using it under the terms of the CERN-OHL-W v2 (https://cern.ch/cern-ohl). This source is distributed WITHOUT ANY EXPRESS OR IMPLIED WARRANTY, INCLUDING OF MERCHANTABILITY, SATISFACTORY QUALITY AND FITNESS FOR A PARTICULAR PURPOSE. Please see the CERN-OHL-W v2 for applicable conditions.
  Notice: If You produce hardware based on this source, You must maintain the Source Location visible on the product, its packaging or its documentation.
- SINARA OPEN HARDWARE
- OPEN HARDWARE FOR SCIENTIFIC INSTRUMENTATION
- https://github.com/sinara-hw
- Release owner
- Designers
- Reviewers
- Source location:

### Library data of the parts
T_C13 T_C16-T_C19 = CC0402_10NF_50V_5%_X7R: Non-polarised capacitor; Part Description: SMD Multilayer Chip Ceramic Capacitor; Manufacturer: GENERIC; Manufacturer1 Part Number: C0402C103J5RAC; Voltage: 50V; TC: X7R; Tolerance: ±5%; Part Number: CC0402_10NF_50V_5%_X7R; Component Kind: Standard; Component Type: Standard; Pin Count: 2; Value: 10nF; Status: Preferred; Manufacturer Part Number: CC0402_10NF_50V_5%_X7R; Case: 0402; Mounted: Yes; Socket: No; SMD: Yes; Sense: No; Manufacturer1 Example: KEMET; Manufacturer1 ComponentHeight: 0.55mm; HelpURL: \\cern.ch\dfs\Applications\Altium\Datasheets\CC0402_X7R_KEMET.pdf; Author: CERN DEM BC; CreateDate: 15.07.2020; LatestRevisionDate: 15.07.2020
T_C14 T_C15 T_C20 T_C21 = CC0402_100NF_50V_10%_X7R: Non-polarised capacitor; Part Description: SMD Multilayer Chip Ceramic Capacitor; Manufacturer: GENERIC; Manufacturer1 Part Number: GRM155R71H104KE14D; Voltage: 50V; TC: X7R; Tolerance: ±10%; Part Number: CC0402_100NF_50V_10%_X7R; Component Kind: Standard; Component Type: Standard; Pin Count: 2; Value: 100nF; Status: None; Manufacturer Part Number: CC0402_100NF_50V_10%_X7R; Case: 0402; Mounted: Yes; Socket: No; SMD: Yes; Sense: No; Manufacturer1 Example: MURATA; Manufacturer1 ComponentHeight: 0.55mm; HelpURL: \\cern.ch\dfs\Applications\Altium\Datasheets\CC0402_MURATA_GRM155R71H104KE14D.pdf; Author: CERN DEM MR; CreateDate: 30.06.2017; LatestRevisionDate: 30.06.2017
T_D6 = CDBU0520-HF: Schottky Diode; Part Description: 20V Surface mount Schottky Barrier Diode; Manufacturer: COMCHIP; Voltage: 20V; Power: 500mA; PressFit: No; Bonding: No; Part Number: CDBU0520-HF; Component Kind: Standard; Component Type: Standard; Device: CDBU0520-HF; PackageDescription: Small Outline Diode Flat Lead (SOD-523F), Body; 1.80mm L X 1mm W X 0.85mm H; Manufacturer Part Number: CDBU0520-HF; Pin Count: 2; Case: SOD-523F; Mounted: Yes; Socket: No; SMD: Yes; Sense: No; ComponentHeight: 1mm; HelpURL: \\cern.ch\dfs\Applications\Altium\Datasheets\CDBU0520-HF.pdf; Author: CERN DEM HF; CreateDate: 13.10.2023; LatestRevisionDate: 13.10.2023
T_IC7 = TPS3808G01DBVT: Low Quiescent Current, Programmable-Delay Supervisory Circuit; Part Description: Adjustable Low Quiescent Current, Programmable-Delay Supervisory Circuit; Manufacturer: TEXAS INSTRUMENTS; PressFit: No; Bonding: No; Part Number: TPS3808G01DBVT; Component Kind: Standard; Component Type: Standard; Device: TPS3808G01DBVT; PackageDescription: SOT, 0.95mm Pitch; 6 Pin, 1.60mm W X 2.90mm L X 1.45mm H body, IPC Medium Density; Manufacturer Part Number: TPS3808G01DBV; Pin Count: 6; Case: SOT23-6; Mounted: Yes; Socket: No; SMD: Yes; Sense: No; ComponentHeight: 1.45mm; Author: CERN DEM JLC; HelpURL: \\cern.ch\dfs\Applications\Altium\Datasheets\TPS3808G01DBVT.pdf; CreateDate: 22.10.2008; LatestRevisionDate: 10.06.2022
T_R29 = R0402_100K_1%_0.0625W_100PPM: Resistor - 1%; Part Description: General Purpose Thick Film Chip Resistor; Manufacturer: GENERIC; Manufacturer1 Part Number: 232270671004L; TC: ±100ppm/°C; PressFit: No; Part Number: R0402_100K_1%_0.0625W_100PPM; Component Kind: Standard; Component Type: Standard; Pin Count: 2; Value: 100k; Status: Not Recommended; Power: 0.0625W; Manufacturer Part Number: R0402_100K_1%_0.0625W_100PPM; Case: 0402; Mounted: Yes; Sense: No; Socket: No; SMD: Yes; Manufacturer1 Example: YAGEO PHYCOMP; Manufacturer1 ComponentHeight: 0.4mm; HelpURL: \\cern.ch\dfs\Applications\Altium\Datasheets\R0402_Phycomp_RC0402.pdf; Author: CERN DEM JLC; CreateDate: 03.12.2007; LatestRevisionDate: 17.10.2012
T_R30 = R0402_3K9_1%_0.0625W_100PPM: as T_R7 on sheet Power_Supplies; Part Number: R0402_3K9_1%_0.0625W_100PPM; Component Kind: Standard; Component Type: Standard; Pin Count: 2; Value: 3k9; Status: Not Recommended; Power: 0.0625W; Manufacturer Part Number: R0402_3K9_1%_0.0625W_100PPM; Case: 0402; Mounted: Yes; Sense: No; Socket: No; SMD: Yes; Manufacturer1 Example: YAGEO PHYCOMP; Manufacturer1 ComponentHeight: 0.4mm; HelpURL: \\cern.ch\dfs\Applications\Altium\Datasheets\R0402_Phycomp_RC0402.pdf; Author: CERN DEM JLC; CreateDate: 03.12.2007; LatestRevisionDate: 17.10.2012
T_R31-T_R34 = R0402_10K_1%_0.0625W_100PPM: as T_R4 on sheet Power_Supplies; Part Number: R0402_10K_1%_0.0625W_100PPM; Component Kind: Standard; Component Type: Standard; Pin Count: 2; Value: 10k; Status: Not Recommended; Power: 0.0625W; Manufacturer Part Number: R0402_10K_1%_0.0625W_100PPM; Case: 0402; Mounted: Yes; Sense: No; Socket: No; SMD: Yes; Manufacturer1 Example: YAGEO PHYCOMP; Manufacturer1 ComponentHeight: 0.4mm; HelpURL: \\cern.ch\dfs\Applications\Altium\Datasheets\R0402_Phycomp_RC0402.pdf; Author: CERN DEM JLC; CreateDate: 03.12.2007; LatestRevisionDate: 17.10.2012
T_T2-T_T5 = BSS138LT1G: N-CHANNEL MOSFET WITH DIODE; Part Description: 50V, 200mA N-Channel Enhancement Mode Field-Effect Transistor; Manufacturer: ON SEMICONDUCTOR; PressFit: No; Bonding: No; Part Number: BSS138LT1G; Component Kind: Standard; Component Type: Standard; Device: BSS138LT1G; PackageDescription: SOT23, 0.95mm Pitch; 3 Pin, 1.40mm W X 3.00mm L X 1.10mm H body, IPC Medium Density; Manufacturer Part Number: BSS138L; Pin Count: 3; Case: SOT23-3; Mounted: Yes; Socket: No; SMD: Yes; Sense: No; ComponentHeight: 1.11mm; HelpURL: \\cern.ch\dfs\Applications\Altium\Datasheets\BSS138LT1G.pdf; Author: CERN DEM JLC; CreateDate: 23.03.2009; LatestRevisionDate: 25.05.2022